# Altium schematic sheet Pyro_Channel.SchDoc: Pyro Channel
size A; CompanyName: Wisconsin Space Program (WISP); Engineer: Evan Williams; Revision: V1; SheetNumber: 1; SheetTotal: 1
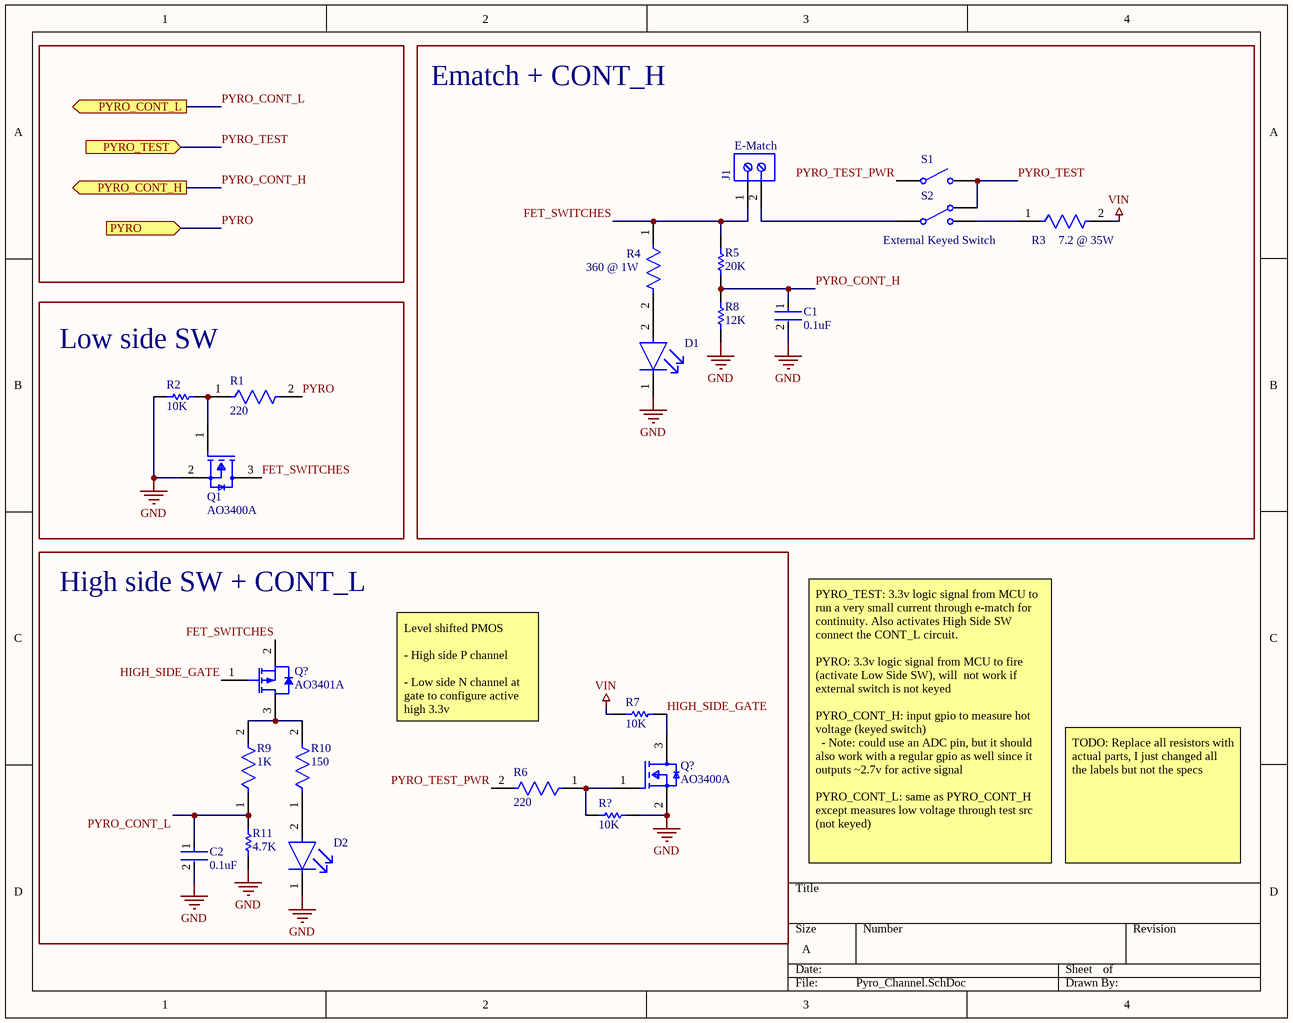
[diagram p0: Pyro_Channel.SchDoc]

## Parts
(Parts that share a designator on the sheet are numbered #1, #2 ... from top to bottom, then left to right.)
C1  0.1uF  [FP-C0603C-CF-MFG]
C2  0.1uF  [FP-C0603C-CF-MFG]
D1  LTST-C190GKT  [FP-LTST-C190GKT-MFG]  (value not drawn)
D2  LTST-C190GKT  [FP-LTST-C190GKT-MFG]  (value not drawn)
J1  691137710002  [691137710002]  (value not drawn)
Q1  AO3400A  [FP-SOT23-MFG]
Q?#1  AO3401A  [AO-SOT-23-3L_V]
Q?#2  AO3400A  [FP-SOT23-MFG]
R1  220  [FP-CRGCQ0603-IPC_C]
R2  10K  [RESC1609X50X30NL8T20]
R3  7.2 @ 35W  [FP-PWR220T-35-MFG]
R4  360 @ 1W  [FP-CRCW2512-e3-IPC_C]
R5  20K  [RESC0603(1608)_M]
R6  220  [FP-CRGCQ0603-IPC_C]
R7  10K  [RESC1609X50X30NL8T20]
R8  12K  [RESC1608X55X25LL10T15]
R9  1K  [FP-CRCW0603-e3-MFG]
R10  150  [FP-RMCF0603-IPC_A]
R11  4.7K  [RESC1608X55X25LL10T15]
R?  10K  [RESC1609X50X30NL8T20]
S1  Single-Pole, Single-Throw Switch  (value not drawn)
S2  Single-Pole, Double-Throw Switch  (value not drawn)

## Blocks framed on the sheet
Ematch + CONT_H: C1 D1 J1 R3-R5 R8 S1 S2
Low side SW: Q1 R1 R2
High side SW + CONT_L: C2 D2 Q?#1 Q?#2 R6 R7 R9-R11 R?

## Ports
PYRO (in), PYRO_CONT_H (out), PYRO_CONT_L (out), PYRO_TEST (in)

## Nets
GND: C1.2 C2.2 D1.1(C) D2.1(C) Q1.2(S) Q?#2.2(S) R2.1 R8.1 R11.1 R?.1
VIN: R3.2 R7.1
FET_SWITCHES: J1.1 Q1.3(D) Q?#1.2(SOURCE) R4.1 R5.2
HIGH_SIDE_GATE: Q?#1.1(GATE) Q?#2.3(D) R7.2
PYRO: R1.2 ; port PYRO
PYRO_CONT_H: C1.1 R5.1 R8.2 ; port PYRO_CONT_H
PYRO_CONT_L: C2.1 R9.1 R11.2 ; port PYRO_CONT_L
PYRO_TEST: S1.2 S2.3 ; port PYRO_TEST
PYRO_TEST_PWR: R6.2 S1.1
NetD1_2: D1.2(A) R4.2
NetD2_2: D2.2(A) R10.1
NetJ1_2: J1.2 S2.1
NetQ1_1: Q1.1(G) R1.1 R2.2
NetQ?#1_3: Q?#1.3(DRAIN) R9.2 R10.2
NetQ?#2_1: Q?#2.1(G) R6.1 R?.2
NetR3_1: R3.1 S2.2

## Notes on the sheet
- (near J1) E-Match
- (near S2) External Keyed Switch
- Level shifted PMOS
  - High side P channel
  - Low side N channel at gate to configure active high 3.3v
- PYRO_TEST: 3.3v logic signal from MCU to run a very small current through e-match for continuity. Also activates High Side SW connect the CONT_L circuit.
  PYRO: 3.3v logic signal from MCU to fire (activate Low Side SW), will  not work if external switch is not keyed
  PYRO_CONT_H: input gpio to measure hot voltage (keyed switch)
  - Note: could use an ADC pin, but it should also work with a regular gpio as well since it outputs ~2.7v for active signal
  PYRO_CONT_L: same as PYRO_CONT_H except measures low voltage through test src (not keyed)
- TODO: Replace all resistors with actual parts, I just changed all the labels but not the specs

## Library data of the parts
C1 C2 = CMP-2006-03061-2: CAP CER 0.1UF 50V X7R 0603; Manufacturer: KEMET; Manufacturer Part Number: C0603C104K5RACTU; Tolerance: 0.1; Temperature Coefficient: 30ppm/°C; Material: Ceramic; Automotive Grade: Grade 1; Value: 0.10 μF; Temperature: -55°C to +125°C; RoHS: TRUE; Temperature Range High: +125°C; Lead Free: Yes; Octopart: https://octopart.com/c0603c104k5ractu-kemet-139244; Digikey Description: CAP CER 0.1UF 50V X7R 0603; Category: Cap; Package: C0603C-CF; ComponentLink2Description: Datasheet; Temperature Range Low: -55°C; Device Class L1: Passive Components; Voltage Rating: 50 V; Automotive: Yes; Device Class L3: Ceramic Capacitors; ComponentLink2URL: https://api.kemet.com/component-edge/download/datasheet/C0603C100J5GACAUTO.pdf; Capacitance: 0.10 μF; Device Class L2: Capacitors; Temperature Characteristic: X7R; Height: 0.87mm
D1 D2 = CMP-22017-000005-2: LED GREEN CLEAR CHIP SMD; Dominant Wavelength: 569nm; Reverse Voltage: 5V; Lens Color: Colorless; Viewing Angle: 130°; Voltage: 2V; Forward Current: 30mA; Power Dissipation: 100mW; Luminous Intensity: 6mcd; Number of LEDs: 1; Forward Voltage: 2.1V; Wavelength: 565nm; Test Current: 10mA; Min Operating Temperature: -55°C; Lens Style: Clear; Mount: Surface Mount; Width: 0.8mm; Packaging: Tape and Reel; Lens Transparency: Clear; Case Code (Metric): 1608; Depth: 0.8mm; Case Code (Imperial): 0603; Case/Package: 0603; Number of Pins: 2; Max Operating Temperature: 85°C; Lead Free: Lead Free; Number of Elements: 1; Length: 1.6mm; Height: 0.8mm; Package Quantity: 1; Power Rating: 100mW; Radiation Hardening: No; Illumination Color: Green; Color: Green
J1 = CMP-1502-03324-3: Terminal Block, 5MM Pitch, Horizontal, Pressure Clamp Glow Wire, Pcb, 2PINS, Gr; Current Rating: 16A; Number of Contacts: 2; Voltage Rating: 300V; Number of Pins: 2; Min Operating Temperature: -30°C; Lead Pitch: 5mm; Packaging: Box; Max Operating Temperature: 120°C; RoHS: Compliant; Number of Rows: 1; Height: 11.6mm; Contact Material: Nickel, Tin
Q1 Q?#2 = CMP-83955-000006-1: MOSFET N-CH 30V 5.7A SOT23; Input Capacitance: 630pF; Number of Elements: 1; Rds On Max: 26.5mR; Max Power Dissipation: 1.4W; Gate to Source Voltage (Vgs): 12V; Min Operating Temperature: -55°C; Lead Free: Lead Free; Number of Pins: 3; Drain to Source Voltage (Vdss): 30V; Case/Package: SOT-23; Mount: Surface Mount; Continuous Drain Current (ID): 5.7A; Radiation Hardening: No; Packaging: Tape and Reel; Max Operating Temperature: 150°C; Power Dissipation: 1.4W
Q?#1 = CMP-2000-05778-1: P-Channel MOSFET, 30 V, 4 A, -55 to 150 degC, 3-Pin SOT-23-3L, RoHS, Tape and Reel; Manufacturer: Alpha and Omega; Output Power (Max): NotRequiredW; Power Dissipation: 1.4W; Rad Hardened: No; Drain Efficiency: NotRequired%; Drain-Source On-Volt: 30V; Noise Figure: NotRequireddB; Frequency (Max): NotRequiredMHz; Number of  Elements: 1; Gate-Source Voltage (Max): ?12V; Drain Current (Max): 4A; Channel Mode: Enhancement; Drain-Source On-Res: 0.044ohm; Type: PowerMOSFET; Polarity: P; Package URL: http://www.aosmd.com/res/packaging_information/SOT-23-3L.pdf; Datasheet URL: http://www.aosmd.com/res/data_sheets/AO3401A.pdf; Package Type: SOT-23; Package Description: 3-Pin Small Outline Transistor, Body 2.95 x 1.6 mm, Pitch 0.95 mm; Mounting: SurfaceMount; Manufacturer URL: http://www.aosmd.com/; Continuous Drain Current: 4A; Package Reference: SOT-23-3L; Mounting Technology: SurfaceMount; Operating Temperature Classification: Military; Power Gain: NotRequireddB; Datasheet Version: Rev. 3, 03/2011; Operating Temp Range: -55Cto150C; Pin Count: 3
R1 R6 = CMP-03211-002975-1: CRGCQ 0603 220R 5%; Manufacturer: TE Connectivity; Manufacturer Part Number: CRGCQ0603J220R; Power Rating: 0.1W; Voltage Rating: 75V; Temperature Coefficient: ±100ppm/°C; Tolerance: 0.05; Value: 220Ω; Package: CRGCQ0603; Temperature: -55°C to +155°C; Device Class L3: Chip SMD Resistors; Device Class L1: Passive Components; Device Class L2: Resistors; ComponentLink2Description: Datasheet; Lead Free: Yes; Height: 0.55mm; Digikey Description: CRGCQ 0603 220R 5%; RoHS: TRUE; Temperature Range High: +155°C; Mouser Description: SMD AEC-Q200 Compliant Thick Film Chip Resistor; Temperature Range Low: -55°C; Ambient Temperature Range High: +70°C; Octopart: https://octopart.com/crgcq0603j220r-te+connectivity-91018111; Category: Res; Resistance: 220Ω; ComponentLink2URL: https://www.te.com/commerce/DocumentDelivery/DDEController?Action=showdoc&DocId=Data+Sheet%7F1773204-3%7F1%7Fpdf%7FEnglish%7FENG_DS_1773204-3_1.pdf%7F4-2176339-539; Ipc Land Pattern Name: RESC16080X45; Composition: Thick Film; Series: CRGCQ
R2 R7 R? = CMP-1666-00005-4: Chip Resistor, 10 KOhm, +/- 1%, 100 mW, -55 to 155 degC, 0603 (1608 Metric), RoHS, Tape and Reel; Manufacturer: Vishay Semiconductor; Voltage Rating: 75 V; Max Operating Temperature: 155 degC; PackageDescription: 2-Pin Surface Mount Device, Body 1.575 x 0.85 mm; ComponentLink1Description: Manufacturer URL; RoHSCompliant: true; PackageReference: 0603; REACH SVHC: Unknown; Length: 1.55 mm; DatasheetVersion: 06/2012; Packaging: Tape and Reel; Min Operating Temperature: -55 degC; Mounting Technology: Surface Mount; ComponentLink2URL: https://datasheet.ciiva.com/11809/0900766b80d98afc-11809037.pdf; Height: 0.45 mm; ComponentLink2Description: Datasheet; Package Quantity: 5000; ComponentLink1URL: http://www.vishay.com/
R3 = CMP-00059-89408923-1: PWR220T-35-22R0J Res Thick Film 22 Ohm 5% 35W ±100ppm/C Epoxy TO-220 RDL Automotive AEC-Q200 Tube; Resistance: 22Ω; Temperature Coefficient: 100ppm/°C; Voltage Rating: 250V; NexarPartId: 89408923; Schedule B: 8533290000, 8533290000; Tolerance: 5%; Max Operating Temperature: 155°C; Height: 14.98mm; Composition: Thick Film; Min Operating Temperature: -55°C; Power Rating: 35W
R4 = CMP-02407-005880-1: RES Thick Film, 1kΩ, 1%, 1W, 100ppm/°C, 2512; Resistance: 1kR; Voltage Rating (DC): 500V; Case Code (Metric): 6432; Height: 0.6mm; Termination: SMD/SMT; Weight: 0.001429oz; Packaging: Tape and Reel; Composition: Thick Film; Number of Terminations: 2; Mount: Surface Mount; Max Operating Temperature: 155°C; Tolerance: 1%; Width: 3.15mm; Features: Automotive AEC-Q200; Contact Plating: Tin; Package Quantity: 10; Temperature Coefficient: 100ppm/°C; Lead Free: Lead Free; Power Rating: 1W; Min Operating Temperature: -55°C; Number of Pins: 2; Case/Package: 2512; Military Standard: Not; Max Power Dissipation: 1W; Length: 6.3mm; Depth: 3.15mm; Radiation Hardening: No; Case Code (Imperial): 2512; Voltage Rating: 500V
R5 = CMP-1012-00094-1: 6K8 0.1W 5% 0603 (1608 Metric)  SMD; Case-EIA: 0603; Case-Metric: 1608; Value: 6800.00 Ohm; Tolerance: 5 %; Power: 0.1 W; Technology: SMT
R8 = CMP-2000-04296-1: Part Number: RC0603JR-07910RL; Manufacturer: Yageo
R9 = CMP-1666-00003-5: RES Thick Film, 1kΩ, 1%, 0.1W, 100ppm/°C, 0603; Max Power Dissipation: 100mW; Voltage Rating: 75V; Resistance: 1kR; Max Operating Temperature: 155°C; Number of Pins: 2; Case Code (Imperial): 0603; Width: 0.033inch; Power Rating: 100mW; Number of Terminations: 2; Package Quantity: 10; Weight: 7.1E-05oz; Tolerance: 1%; Temperature Coefficient: 100ppm/°C; Military Standard: Not; Mount: Surface Mount; Voltage Rating (DC): 75V; Depth: 0.85mm; Composition: Thick Film; Radiation Hardening: No; Termination: SMD/SMT; Length: 1.55mm; Case Code (Metric): 1608; Contact Plating: Tin; Min Operating Temperature: -55°C; Packaging: Tape and Reel; Height: 0.45mm; Lead Free: Lead Free; Case/Package: 0603; Features: Automotive AEC-Q200
R10 = CMP-26527-000075-1: 150Ω ±1% 0.1W 0603 Thick Film Chip Resistor AEC-Q200 compliant; Power Rating: 100mW; Resistance: 150R; Temperature Coefficient: 100ppm/°C; Radiation Hardening: No; Features: Automotive AEC-Q200; Max Operating Temperature: 155°C; Lead Free: Lead Free; Resistor Type: Thick Film; Series: RMCF; RoHS Compliant: Yes; Case/Package: 0603; Contact Plating: Tin; Max Power Dissipation: 100mW; Case Code (Metric): 1608; Width: 0.031inch; Packaging: Tape and Reel; Case Code (Imperial): 0603; Size Code: 0603; Number of Terminations: 2; Height: 0.022inch; Tolerance: 1%; Length: 0.061inch; Min Operating Temperature: -55°C; Mount: Surface Mount
R11 = CMP-2000-06942-1: Chip Resistor, 4.7 KOhm, +/- 1%, 0.1 W, -55 to 155 degC, 0603 (1608 Metric), RoHS, Tape and Reel; Manufacturer: Yageo; Power Rating: 100mW; Temperature Coefficient: 100PPM/C; Resistance: 4.7kOhms; Voltage Rating: 50V; Package Reference: 0603; Series: RC; Datasheet Version: Rev. 7, 05/2017; Packaging: Reel; Termination Style: SMD/SMT; Datasheet URL: http://www.yageo.com/documents/recent/PYu-RC_Group_51_RoHS_L_7.pdf; Manufacturer URL: http://www.yageo.com/; Package Description: 2-Pin Surface Mount Device, Body 1.6 x 0.8 mm; Case Code - mm: 1608; Case Code - in: 0603; Mounting Technology: SurfaceMount; Operating Temperature Range: -55Cto+155C; Tolerance: 1%; Product: ThickFilmResistorsGeneralPurpose
S1 = SPST SW: closed: 0; Rclosed: 1m; Ropen: 1Meg; SimulationGenericComponent: True
S2 = SPDT SW: nodeUP_closed: 1; Rclosed: 1m; Ropen: 1Meg; SimulationGenericComponent: True